# Altium schematic sheet Sheet1.SchDoc
size A4; SheetNumber: 1; SheetTotal: 1
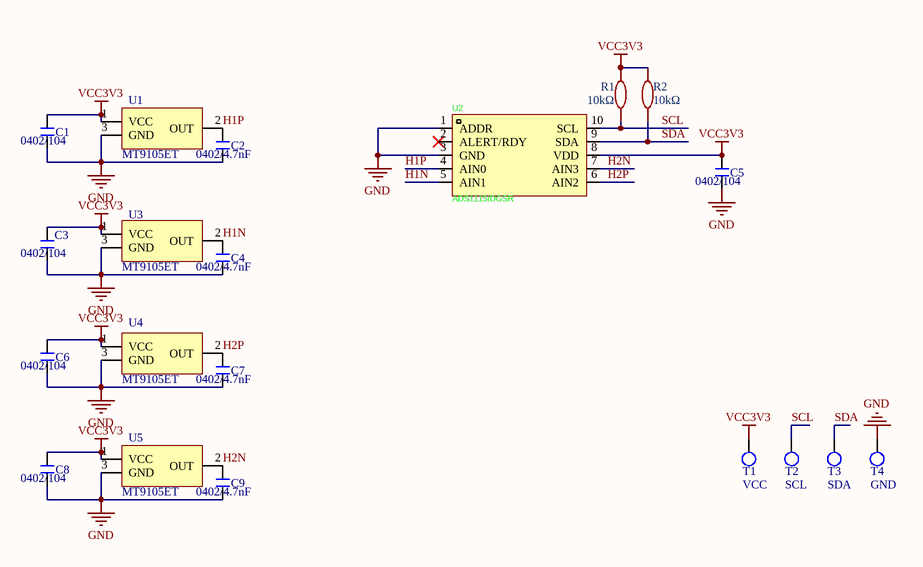
[diagram p0: Sheet1.SchDoc]

## Parts
C1  0402/104  [0402C]
C2  0402/4.7nF  [0402C]
C3  0402/104  [0402C]
C4  0402/4.7nF  [0402C]
C5  0402/104  [0402C]
C6  0402/104  [0402C]
C7  0402/4.7nF  [0402C]
C8  0402/104  [0402C]
C9  0402/4.7nF  [0402C]
R1  10kΩ  [R0402]
R2  10kΩ  [R0402]
T1  VCC  [BLDC_P]
T2  SCL  [BLDC_P]
T3  SDA  [BLDC_P]
T4  GND  [BLDC_P]
U1  MT9105ET  [SOT-23-3_L2.9]
U2  ADS1115IDGSR  [MSOP-10]
U3  MT9105ET  [SOT-23-3_L2.9]
U4  MT9105ET  [SOT-23-3_L2.9]
U5  MT9105ET  [SOT-23-3_L2.9]

## Nets
GND: C1.1 C2.1 C3.1 C4.1 C5.1 C6.1 C7.1 C8.1 C9.1 T4.1 U1.3(GND) U2.1(ADDR) U2.3(GND) U3.3(GND) U4.3(GND) U5.3(GND)
VCC3V3: C1.2 C3.2 C5.2 C6.2 C8.2 R1.2 R2.2 T1.1 U1.1(VCC) U2.8(VDD) U3.1(VCC) U4.1(VCC) U5.1(VCC)
H1N: C4.2 U2.5(AIN1) U3.2(OUT)
H1P: C2.2 U1.2(OUT) U2.4(AIN0)
H2N: C9.2 U2.7(AIN3) U5.2(OUT)
H2P: C7.2 U2.6(AIN2) U4.2(OUT)
SCL: R1.1 T2.1 U2.10(SCL)
SDA: R2.1 T3.1 U2.9(SDA)

Not connected (* = marked no-connect by the designer): U2 2(ALERT/RDY)*

## Library data of the parts
C1-C9 = C: 贴片电容; value: 104; 嘉立创元件编号: C110251
R1 R2 = 0402WGF1002TCE: Manufacturer: UNI-ROYAL(厚声); Add into BOM: yes; Tolerance: ±1%; Power(Watts): 62.5mW; Voltage-Supply(Max): 50V; Temperature Coefficient: ±100ppm/℃; Symbol: 0402WGF1002TCE; Device: 0402WGF1002TCE; Value: 10kΩ; LCSC Part Name: 10kΩ ±1% 62.5mW 厚膜电阻; Supplier Part: C25744; Manufacturer Part: 0402WGF1002TCE; Supplier Footprint: 0402; JLCPCB Part Class: Basic Part; Datasheet: https://item.szlcsc.com/datasheet/0402WGF1002TCE/26487.html; Supplier: LCSC; Convert to PCB: yes; Type: 厚膜电阻; Operating Temperature: -55℃~+155℃
T1-T4 = Test Point: 测试点
U1 U3-U5 = MT9105ET: 线性磁感应霍尔
U2 = ADS1115IDGSR: ADC采样芯片，IIC通信; Manufacturer: TI(德州仪器); Add into BOM: yes; Resolution(Bits): 16位; number of channels: 4; Voltage - Supply: 2V~5.5V; Interface: I2C; Integral non - linearity: 1LSB; Symbol: ADS1115IDGSR; Device: ADS1115IDGSR; LCSC Part Name: 具有内部基准、振荡器和可编程比较器且兼容 I2C 的ADS111x、超小型、低功耗 860SPS、16位ADC; Supplier Part: C37593; Manufacturer Part: ADS1115IDGSR; Supplier Footprint: VSSOP-10; JLCPCB Part Class: Extended Part; Datasheet: https://www.ti.com/cn/lit/gpn/ads1115; Supplier: LCSC; Convert to PCB: yes; Sampling Rate: -; differential input: -; Operating Temperature: -40℃~+125℃